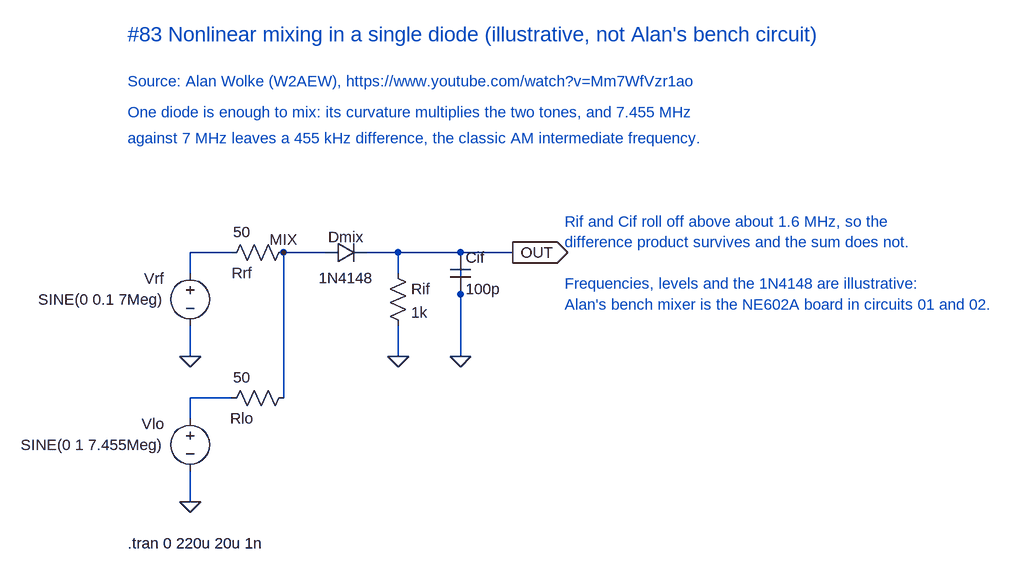
[diagram p0: schematic Nonlinear RF frequency conversion example.asc]
Nonlinear RF frequency conversion example.asc, the LTspice schematic file:
Version 4.1
SHEET 1 1100 800
WIRE 64 0 64 32
WIRE 128 0 64 0
WIRE 272 0 208 0
WIRE 384 0 336 0
WIRE 480 0 384 0
WIRE 560 0 480 0
WIRE 64 112 64 160
WIRE 64 224 64 256
WIRE 128 224 64 224
WIRE 208 224 208 0
WIRE 64 336 64 384
WIRE 384 32 384 0
WIRE 384 160 384 112
WIRE 480 64 480 0
WIRE 480 160 480 64
FLAG 64 160 0
FLAG 64 384 0
FLAG 384 160 0
FLAG 480 160 0
FLAG 208 0 MIX
FLAG 560 0 OUT
IOPIN 560 0 Out
SYMBOL voltage 64 16 R0
WINDOW 123 0 0 Left 0
WINDOW 39 0 0 Left 0
WINDOW 0 -40 24 Right 2
WINDOW 3 -40 56 Right 2
SYMATTR InstName Vrf
SYMATTR Value SINE(0 0.1 7Meg)
SYMBOL voltage 64 240 R0
WINDOW 123 0 0 Left 0
WINDOW 39 0 0 Left 0
WINDOW 0 -40 24 Right 2
WINDOW 3 -40 56 Right 2
SYMATTR InstName Vlo
SYMATTR Value SINE(0 1 7.455Meg)
SYMBOL res 112 16 R270
WINDOW 0 0 32 VBottom 2
WINDOW 3 32 32 VTop 2
SYMATTR InstName Rrf
SYMATTR Value 50
SYMBOL res 112 240 R270
WINDOW 0 0 32 VBottom 2
WINDOW 3 32 32 VTop 2
SYMATTR InstName Rlo
SYMATTR Value 50
SYMBOL diode 272 16 R270
WINDOW 0 24 32 VTop 2
WINDOW 3 -8 32 VBottom 2
SYMATTR InstName Dmix
SYMATTR Value 1N4148
SYMBOL res 368 16 R0
SYMATTR InstName Rif
SYMATTR Value 1k
SYMBOL cap 464 0 R0
SYMATTR InstName Cif
SYMATTR Value 100p
TEXT -32 -336 Left 3 ;#83 Nonlinear mixing in a single diode (illustrative, not Alan's bench circuit)
TEXT -32 -264 Left 2 ;Source: Alan Wolke (W2AEW), https://www.youtube.com/watch?v=Mm7WfVzr1ao
TEXT -32 -216 Left 2 ;One diode is enough to mix: its curvature multiplies the two tones, and 7.455 MHz
TEXT -32 -176 Left 2 ;against 7 MHz leaves a 455 kHz difference, the classic AM intermediate frequency.
TEXT 640 -48 Left 2 ;Rif and Cif roll off above about 1.6 MHz, so the
TEXT 640 -16 Left 2 ;difference product survives and the sum does not.
TEXT 640 48 Left 2 ;Frequencies, levels and the 1N4148 are illustrative:
TEXT 640 80 Left 2 ;Alan's bench mixer is the NE602A board in circuits 01 and 02.
TEXT -32 448 Left 2 !.tran 0 220u 20u 1n

The netlist it stands for:
* Nonlinear RF frequency conversion example.asc
Vrf N001 0 SINE(0 0.1 7Meg)
Vlo N002 0 SINE(0 1 7.455Meg)
Rrf N001 MIX 50
Rlo N002 MIX 50
Dmix MIX 0 1N4148
Rif 0 0 1k
Cif 0 0 100p
.model D D
.lib standard.dio
* #83 Nonlinear mixing in a single diode (illustrative, not Alan's bench circuit)
* Source: Alan Wolke (W2AEW), https://www.youtube.com/watch?v=Mm7WfVzr1ao
* One diode is enough to mix: its curvature multiplies the two tones, and 7.455 MHz
* against 7 MHz leaves a 455 kHz difference, the classic AM intermediate frequency.
* Rif and Cif roll off above about 1.6 MHz, so the
* difference product survives and the sum does not.
* Frequencies, levels and the 1N4148 are illustrative:
* Alan's bench mixer is the NE602A board in circuits 01 and 02.
.tran 0 220u 20u 1n
.backanno
.end